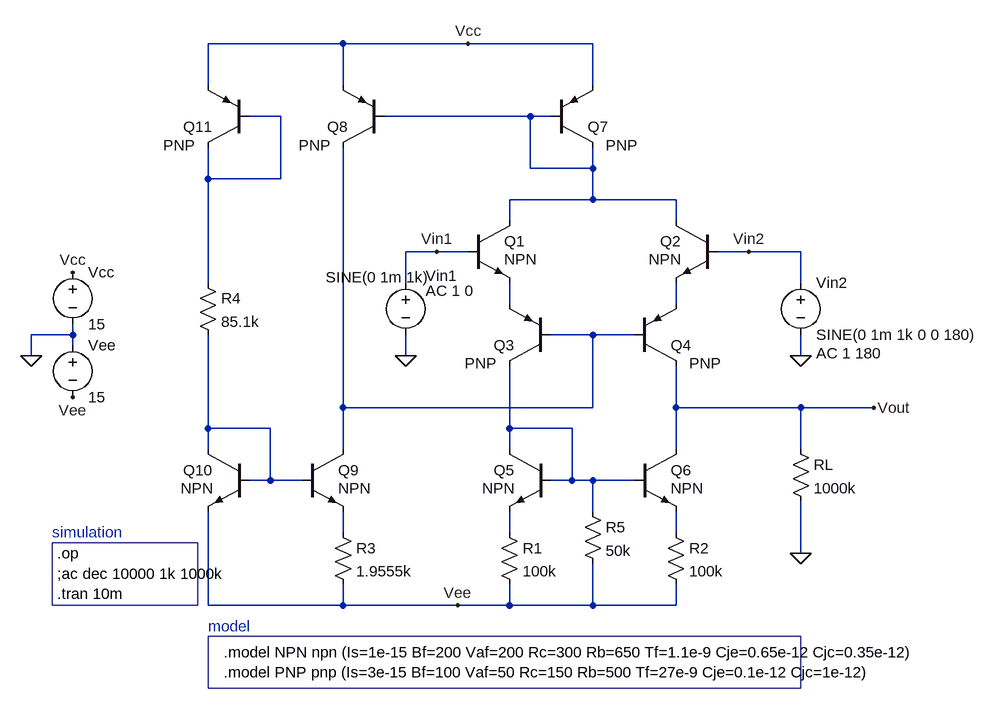
[diagram p0: schematic offsetImprovingCircuit.asc]
offsetImprovingCircuit.asc, the LTspice schematic file:
Version 4
SHEET 1 880 868
WIRE -640 -208 -848 -208
WIRE -448 -208 -640 -208
WIRE -256 -208 -448 -208
WIRE -848 -144 -848 -208
WIRE -640 -144 -640 -208
WIRE -256 -144 -256 -208
WIRE -736 -96 -784 -96
WIRE -352 -96 -576 -96
WIRE -320 -96 -352 -96
WIRE -352 -16 -352 -96
WIRE -256 -16 -256 -48
WIRE -256 -16 -352 -16
WIRE -848 0 -848 -48
WIRE -736 0 -736 -96
WIRE -736 0 -848 0
WIRE -256 32 -256 -16
WIRE -256 32 -384 32
WIRE -128 32 -256 32
WIRE -384 64 -384 32
WIRE -128 64 -128 32
WIRE -496 112 -544 112
WIRE -448 112 -496 112
WIRE -16 112 -64 112
WIRE 64 112 -16 112
WIRE -848 160 -848 0
WIRE -544 160 -544 112
WIRE 64 160 64 112
WIRE -384 192 -384 160
WIRE -128 192 -128 160
WIRE -1056 240 -1056 224
WIRE -1056 240 -1120 240
WIRE -256 240 -320 240
WIRE -192 240 -256 240
WIRE -1056 256 -1056 240
WIRE -1120 272 -1120 240
WIRE -544 272 -544 240
WIRE 64 272 64 240
WIRE -640 352 -640 -48
WIRE -256 352 -256 240
WIRE -256 352 -640 352
WIRE -128 352 -128 288
WIRE 64 352 -128 352
WIRE 176 352 64 352
WIRE -848 384 -848 240
WIRE -752 384 -848 384
WIRE -384 384 -384 288
WIRE -288 384 -384 384
WIRE -848 416 -848 384
WIRE -640 416 -640 352
WIRE -384 416 -384 384
WIRE -128 416 -128 352
WIRE 64 416 64 352
WIRE -752 464 -752 384
WIRE -752 464 -784 464
WIRE -704 464 -752 464
WIRE -288 464 -288 384
WIRE -288 464 -320 464
WIRE -256 464 -288 464
WIRE -192 464 -256 464
WIRE -256 512 -256 464
WIRE -640 544 -640 512
WIRE -384 544 -384 512
WIRE -128 544 -128 512
WIRE 64 576 64 496
WIRE -848 656 -848 512
WIRE -640 656 -640 624
WIRE -640 656 -848 656
WIRE -464 656 -640 656
WIRE -384 656 -384 624
WIRE -384 656 -464 656
WIRE -256 656 -256 592
WIRE -256 656 -384 656
WIRE -128 656 -128 624
WIRE -128 656 -256 656
FLAG 64 576 0
FLAG 64 272 0
FLAG -544 272 0
FLAG -1120 272 0
FLAG -1056 144 Vcc
FLAG -448 -208 Vcc
FLAG -1056 336 Vee
FLAG -464 656 Vee
FLAG 176 352 Vout
FLAG -496 112 Vin1
FLAG -16 112 Vin2
SYMBOL npn -448 64 R0
WINDOW 3 56 60 Left 2
SYMATTR InstName Q1
SYMBOL npn -64 64 M0
WINDOW 3 56 60 Left 2
SYMATTR InstName Q2
SYMBOL npn -784 416 M0
WINDOW 3 56 60 Left 2
SYMATTR InstName Q10
SYMBOL npn -704 416 R0
WINDOW 3 56 60 Left 2
SYMATTR InstName Q9
SYMBOL npn -320 416 M0
WINDOW 3 56 60 Left 2
SYMATTR InstName Q5
SYMBOL npn -192 416 R0
WINDOW 3 56 60 Left 2
SYMATTR InstName Q6
SYMBOL pnp -576 -48 R180
WINDOW 3 84 4 Left 2
SYMATTR InstName Q8
SYMBOL pnp -320 288 R180
WINDOW 3 84 4 Left 2
SYMATTR InstName Q3
SYMBOL pnp -192 288 M180
WINDOW 3 84 4 Left 2
SYMATTR InstName Q4
SYMBOL pnp -784 -48 R180
WINDOW 3 84 4 Left 2
SYMATTR InstName Q11
SYMBOL res -400 528 R0
SYMATTR InstName R1
SYMATTR Value 100k
SYMBOL res -144 528 R0
SYMATTR InstName R2
SYMATTR Value 100k
SYMBOL res -656 528 R0
SYMATTR InstName R3
SYMATTR Value 1.9555k
SYMBOL res -864 144 R0
SYMATTR InstName R4
SYMATTR Value 85.1k
SYMBOL res 48 400 R0
SYMATTR InstName RL
SYMATTR Value 1000k
SYMBOL voltage -544 144 R0
WINDOW 3 -123 7 Left 2
WINDOW 123 31 28 Left 2
WINDOW 39 0 0 Left 0
WINDOW 0 31 5 Left 2
SYMATTR Value SINE(0 1m 1k)
SYMATTR Value2 AC 1 0
SYMATTR InstName Vin1
SYMBOL voltage 64 144 R0
WINDOW 123 24 124 Left 2
WINDOW 39 0 0 Left 0
SYMATTR Value2 AC 1 180
SYMATTR InstName Vin2
SYMATTR Value SINE(0 1m 1k 0 0 180)
SYMBOL voltage -1056 128 R0
WINDOW 123 0 0 Left 0
WINDOW 39 0 0 Left 0
SYMATTR InstName Vcc
SYMATTR Value 15
SYMBOL voltage -1056 240 R0
SYMATTR InstName Vee
SYMATTR Value 15
SYMBOL pnp -320 -48 M180
WINDOW 3 84 4 Left 2
SYMATTR InstName Q7
SYMBOL res -272 496 R0
SYMATTR InstName R5
SYMATTR Value 50k
TEXT -824 728 Left 2 !.model NPN npn (Is=1e-15 Bf=200 Vaf=200 Rc=300 Rb=650 Tf=1.1e-9 Cje=0.65e-12 Cjc=0.35e-12)\n.model PNP pnp (Is=3e-15 Bf=100 Vaf=50 Rc=150 Rb=500 Tf=27e-9 Cje=0.1e-12 Cjc=1e-12)
TEXT -1080 576 Left 2 !.op\n;ac dec 10000 1k 1000k\n.tran 10m
TEXT -848 688 Left 2 ;model
TEXT -1088 544 Left 2 ;simulation
RECTANGLE Normal 64 784 -848 704
RECTANGLE Normal -864 656 -1088 560

The netlist it stands for:
* offsetImprovingCircuit.asc
Q1 N002 Vin1 N003 0 NPN
Q2 N002 Vin2 N004 0 NPN
Q10 N006 N006 Vee 0 NPN
Q9 N005 N006 N008 0 NPN
Q5 N007 N007 N009 0 NPN
Q6 Vout N007 N010 0 NPN
Q8 N005 N002 Vcc 0 PNP
Q3 N007 N005 N003 0 PNP
Q4 Vout N005 N004 0 PNP
Q11 N001 N001 Vcc 0 PNP
R1 N009 Vee 100k
R2 N010 Vee 100k
R3 N008 Vee 1.9555k
R4 N001 N006 85.1k
RL Vout 0 1000k
Vin1 Vin1 0 SINE(0 1m 1k) AC 1 0
Vin2 Vin2 0 SINE(0 1m 1k 0 0 180) AC 1 180
Vcc Vcc 0 15
Vee 0 Vee 15
Q7 N002 N002 Vcc 0 PNP
R5 N007 Vee 50k
.model NPN NPN
.model PNP PNP
.lib standard.bjt
.model NPN npn (Is=1e-15 Bf=200 Vaf=200 Rc=300 Rb=650 Tf=1.1e-9 Cje=0.65e-12 Cjc=0.35e-12)
.model PNP pnp (Is=3e-15 Bf=100 Vaf=50 Rc=150 Rb=500 Tf=27e-9 Cje=0.1e-12 Cjc=1e-12)
.op
;ac dec 10000 1k 1000k
.tran 10m
* model
* simulation
.backanno
.end